# EasyEDA Pro project SOP100E 2025.05.27.eprj, schematic Schematic2

## Sheets
1 P1: Board Name: Board2; Create Date: 2026-01-20; Page Name: P1; Project Name: SOP100E 2025.05.27; Schematic Name: Schematic2; Update Date: 2026-01-21; Company: 嘉立创EDA; Page Size: A4; Version: V1.0
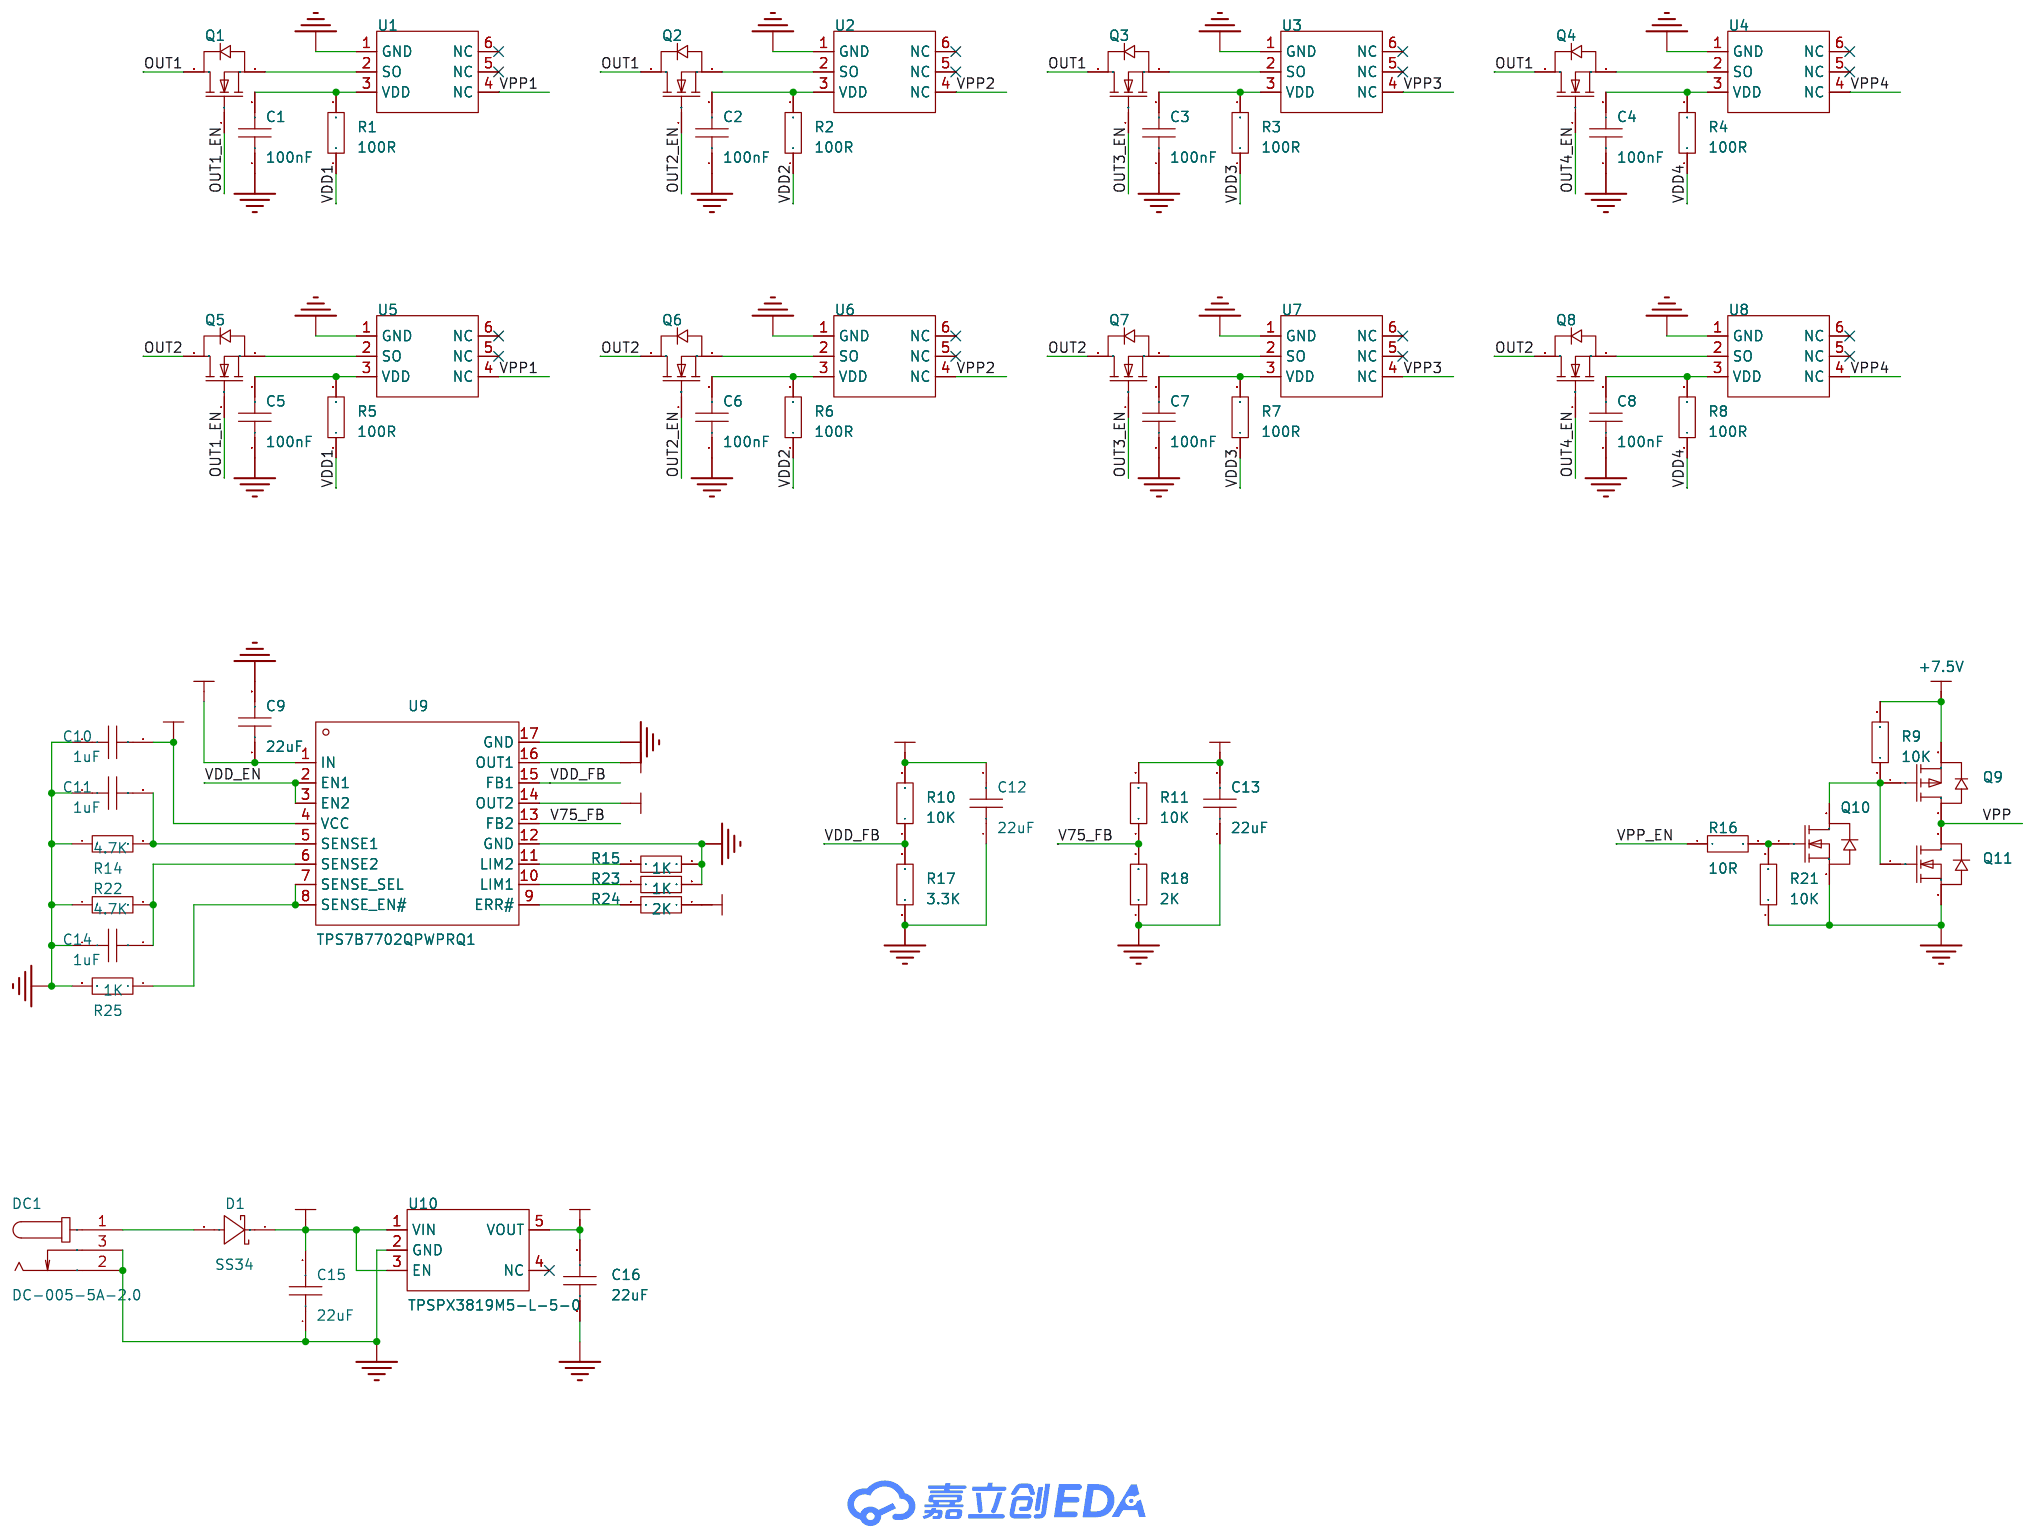
[diagram p12: P1]
2 P3: Create Date: 2026-01-21; Page Name: P3
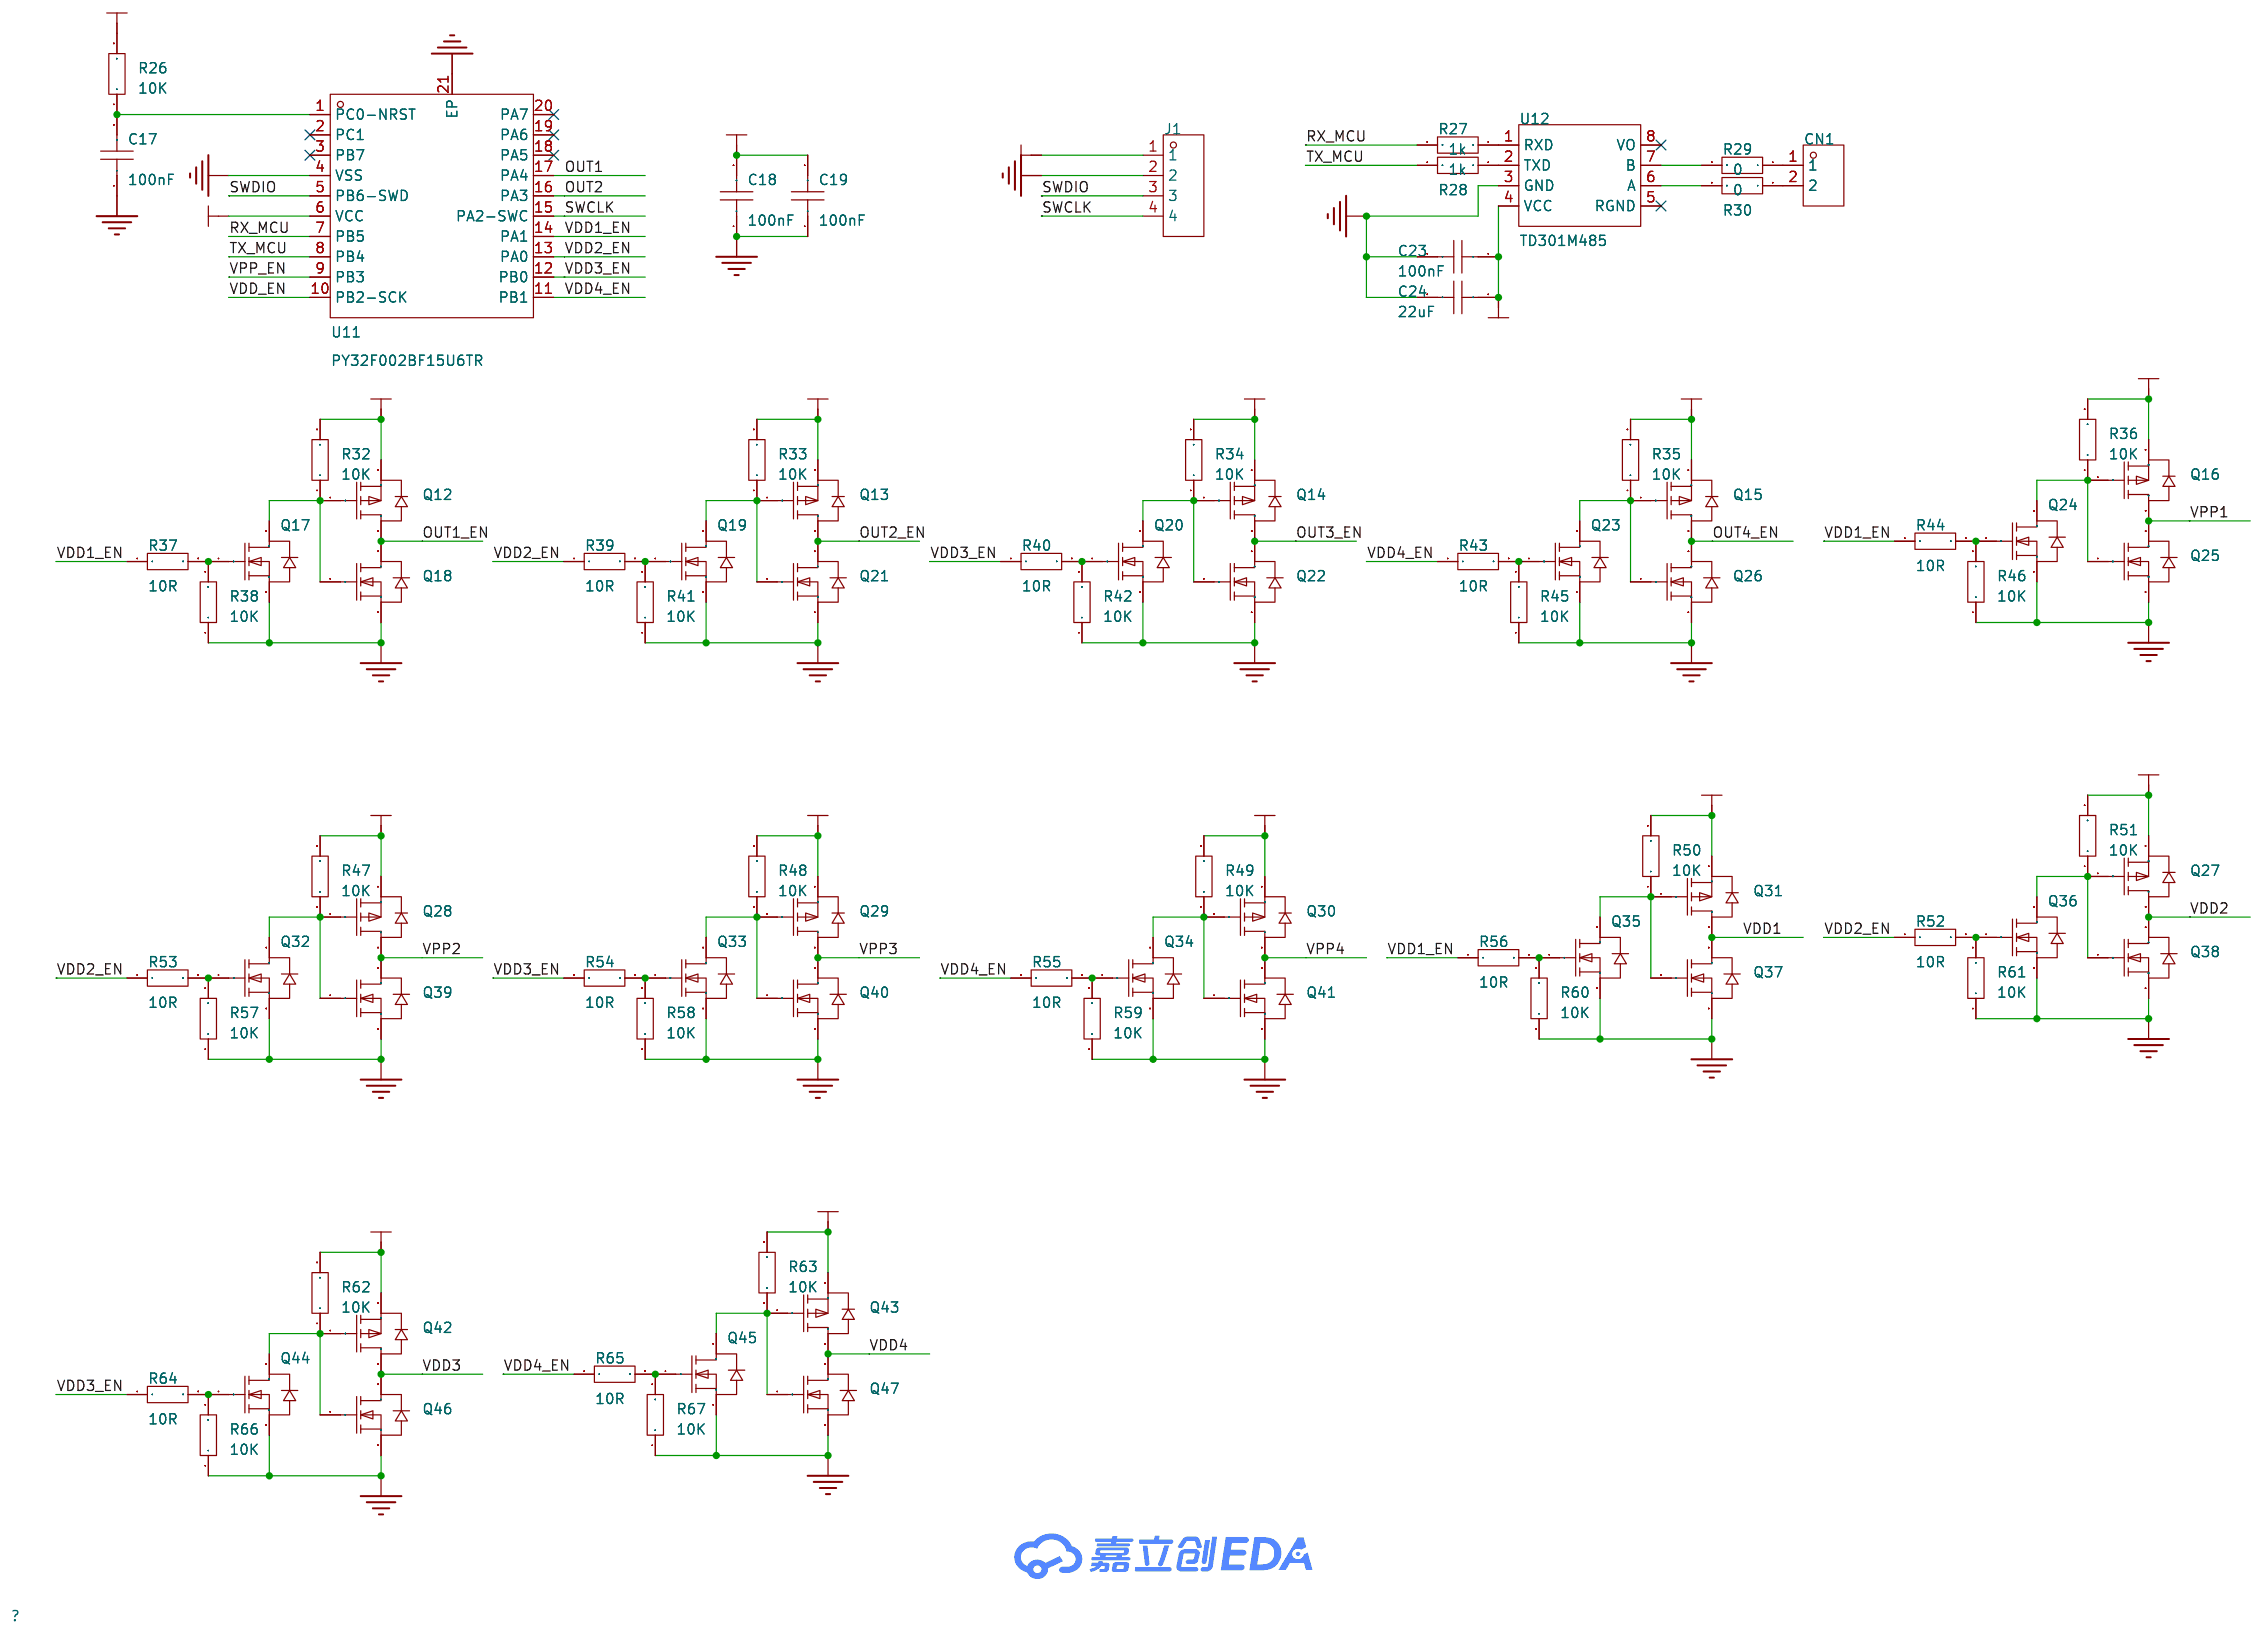
[diagram p13: P3]

## Parts
sheet P1
C1  100nF  [C0603]
C2  100nF  [C0603]
C3  100nF  [C0603]
C4  100nF  [C0603]
C5  100nF  [C0603]
C6  100nF  [C0603]
C7  100nF  [C0603]
C8  100nF  [C0603]
C9  22uF  [C0805]
C10  1uF  [C0603]
C11  1uF  [C0603]
C12  22uF  [C0805]
C13  22uF  [C0805]
C14  1uF  [C0603]
C15  22uF  [C0805]
C16  22uF  [C0805]
D1  SS34  [SMA_L4.3-W2.5-LS5.0-RD]
DC1  DC-005-5A-2.0  [DC-IN-TH_DC-005-5A-2.0]
Q1  AO3400A  [SOT-23-3_L2.9-W1.3-P1.90-LS2.4-BR]
Q2  AO3400A  [SOT-23-3_L2.9-W1.3-P1.90-LS2.4-BR]
Q3  AO3400A  [SOT-23-3_L2.9-W1.3-P1.90-LS2.4-BR]
Q4  AO3400A  [SOT-23-3_L2.9-W1.3-P1.90-LS2.4-BR]
Q5  AO3400A  [SOT-23-3_L2.9-W1.3-P1.90-LS2.4-BR]
Q6  AO3400A  [SOT-23-3_L2.9-W1.3-P1.90-LS2.4-BR]
Q7  AO3400A  [SOT-23-3_L2.9-W1.3-P1.90-LS2.4-BR]
Q8  AO3400A  [SOT-23-3_L2.9-W1.3-P1.90-LS2.4-BR]
Q9  AO3401A  [SOT-23_L2.9-W1.3-P1.90-LS2.4-BR]
Q10  AO3400A  [SOT-23-3_L2.9-W1.3-P1.90-LS2.4-BR]
Q11  AO3400A  [SOT-23-3_L2.9-W1.3-P1.90-LS2.4-BR]
R1  100R  [R0603]
R2  100R  [R0603]
R3  100R  [R0603]
R4  100R  [R0603]
R5  100R  [R0603]
R6  100R  [R0603]
R7  100R  [R0603]
R8  100R  [R0603]
R9  10K  [R0603]
R10  10K  [R0603]
R11  10K  [R0603]
R14  4.7K  [R0603]
R15  1K  [R0603]
R16  10R  [R0603]
R17  3.3K  [R0603]
R18  2K  [R0603]
R21  10K  [R0603]
R22  4.7K  [R0603]
R23  1K  [R0603]
R24  2K  [R0603]
R25  1K  [R0603]
U1  WF100E 1BG S6 DA 0.5P4.5 AT  [SOP-6_L7.0-W7.0-P2.54-LS10.3-TL-CW]
U2  WF100E 1BG S6 DA 0.5P4.5 AT  [SOP-6_L7.0-W7.0-P2.54-LS10.3-TL-CW]
U3  WF100E 1BG S6 DA 0.5P4.5 AT  [SOP-6_L7.0-W7.0-P2.54-LS10.3-TL-CW]
U4  WF100E 1BG S6 DA 0.5P4.5 AT  [SOP-6_L7.0-W7.0-P2.54-LS10.3-TL-CW]
U5  WF100E 1BG S6 DA 0.5P4.5 AT  [SOP-6_L7.0-W7.0-P2.54-LS10.3-TL-CW]
U6  WF100E 1BG S6 DA 0.5P4.5 AT  [SOP-6_L7.0-W7.0-P2.54-LS10.3-TL-CW]
U7  WF100E 1BG S6 DA 0.5P4.5 AT  [SOP-6_L7.0-W7.0-P2.54-LS10.3-TL-CW]
U8  WF100E 1BG S6 DA 0.5P4.5 AT  [SOP-6_L7.0-W7.0-P2.54-LS10.3-TL-CW]
U9  TPS7B7702QPWPRQ1  [HTSSOP-16_L5.0-W4.4-P0.65-LS6.4-BL-EP]
U10  TPSPX3819M5-L-5-0  [SOT-23-5_L2.9-W1.6-P0.95-LS2.8-BR]
sheet P3
C17  100nF  [C0603]
C18  100nF  [C0603]
C19  100nF  [C0603]
C23  100nF  [C0603]
C24  22uF  [C0805]
CN1  DB2EVC-2.5-2P-GN  [CONN-TH_2P-P2.50_DB2EVC-2.5-2P-GN]
J1  PZ254V-11-04P  [HDR-TH_4P-P2.54-V-M]
Q12  AO3401A  [SOT-23_L2.9-W1.3-P1.90-LS2.4-BR]
Q13  AO3401A  [SOT-23_L2.9-W1.3-P1.90-LS2.4-BR]
Q14  AO3401A  [SOT-23_L2.9-W1.3-P1.90-LS2.4-BR]
Q15  AO3401A  [SOT-23_L2.9-W1.3-P1.90-LS2.4-BR]
Q16  AO3401A  [SOT-23_L2.9-W1.3-P1.90-LS2.4-BR]
Q17  AO3400A  [SOT-23-3_L2.9-W1.3-P1.90-LS2.4-BR]
Q18  AO3400A  [SOT-23-3_L2.9-W1.3-P1.90-LS2.4-BR]
Q19  AO3400A  [SOT-23-3_L2.9-W1.3-P1.90-LS2.4-BR]
Q20  AO3400A  [SOT-23-3_L2.9-W1.3-P1.90-LS2.4-BR]
Q21  AO3400A  [SOT-23-3_L2.9-W1.3-P1.90-LS2.4-BR]
Q22  AO3400A  [SOT-23-3_L2.9-W1.3-P1.90-LS2.4-BR]
Q23  AO3400A  [SOT-23-3_L2.9-W1.3-P1.90-LS2.4-BR]
Q24  AO3400A  [SOT-23-3_L2.9-W1.3-P1.90-LS2.4-BR]
Q25  AO3400A  [SOT-23-3_L2.9-W1.3-P1.90-LS2.4-BR]
Q26  AO3400A  [SOT-23-3_L2.9-W1.3-P1.90-LS2.4-BR]
Q27  AO3401A  [SOT-23_L2.9-W1.3-P1.90-LS2.4-BR]
Q28  AO3401A  [SOT-23_L2.9-W1.3-P1.90-LS2.4-BR]
Q29  AO3401A  [SOT-23_L2.9-W1.3-P1.90-LS2.4-BR]
Q30  AO3401A  [SOT-23_L2.9-W1.3-P1.90-LS2.4-BR]
Q31  AO3401A  [SOT-23_L2.9-W1.3-P1.90-LS2.4-BR]
Q32  AO3400A  [SOT-23-3_L2.9-W1.3-P1.90-LS2.4-BR]
Q33  AO3400A  [SOT-23-3_L2.9-W1.3-P1.90-LS2.4-BR]
Q34  AO3400A  [SOT-23-3_L2.9-W1.3-P1.90-LS2.4-BR]
Q35  AO3400A  [SOT-23-3_L2.9-W1.3-P1.90-LS2.4-BR]
Q36  AO3400A  [SOT-23-3_L2.9-W1.3-P1.90-LS2.4-BR]
Q37  AO3400A  [SOT-23-3_L2.9-W1.3-P1.90-LS2.4-BR]
Q38  AO3400A  [SOT-23-3_L2.9-W1.3-P1.90-LS2.4-BR]
Q39  AO3400A  [SOT-23-3_L2.9-W1.3-P1.90-LS2.4-BR]
Q40  AO3400A  [SOT-23-3_L2.9-W1.3-P1.90-LS2.4-BR]
Q41  AO3400A  [SOT-23-3_L2.9-W1.3-P1.90-LS2.4-BR]
Q42  AO3401A  [SOT-23_L2.9-W1.3-P1.90-LS2.4-BR]
Q43  AO3401A  [SOT-23_L2.9-W1.3-P1.90-LS2.4-BR]
Q44  AO3400A  [SOT-23-3_L2.9-W1.3-P1.90-LS2.4-BR]
Q45  AO3400A  [SOT-23-3_L2.9-W1.3-P1.90-LS2.4-BR]
Q46  AO3400A  [SOT-23-3_L2.9-W1.3-P1.90-LS2.4-BR]
Q47  AO3400A  [SOT-23-3_L2.9-W1.3-P1.90-LS2.4-BR]
R26  10K  [R0603]
R27  1k  [R0603]
R28  1k  [R0603]
R29  0  [R0603]
R30  0  [R0603]
R32  10K  [R0603]
R33  10K  [R0603]
R34  10K  [R0603]
R35  10K  [R0603]
R36  10K  [R0603]
R37  10R  [R0603]
R38  10K  [R0603]
R39  10R  [R0603]
R40  10R  [R0603]
R41  10K  [R0603]
R42  10K  [R0603]
R43  10R  [R0603]
R44  10R  [R0603]
R45  10K  [R0603]
R46  10K  [R0603]
R47  10K  [R0603]
R48  10K  [R0603]
R49  10K  [R0603]
R50  10K  [R0603]
R51  10K  [R0603]
R52  10R  [R0603]
R53  10R  [R0603]
R54  10R  [R0603]
R55  10R  [R0603]
R56  10R  [R0603]
R57  10K  [R0603]
R58  10K  [R0603]
R59  10K  [R0603]
R60  10K  [R0603]
R61  10K  [R0603]
R62  10K  [R0603]
R63  10K  [R0603]
R64  10R  [R0603]
R65  10R  [R0603]
R66  10K  [R0603]
R67  10K  [R0603]
U11  PY32F002BF15U6TR  [QFN-20_L3.0-W3.0-P0.40-TL-EP1.7]
U12  TD301M485  [COMM-TH_TD301M485]

## Library data of the parts
C1-C8 C10 C11 C14 C17-C19 C23 = CAP_0603: Supplier Footprint: 0603
C9 C12 C13 C15 C16 C24 = CAP_0805: Supplier Footprint: 0805
D1 = SS34_C727060: 二极管配置:独立式;正向压降(Vf):550mV@3A;直流反向耐压(Vr):40V;平均整流电流(Io):3A;; LCSC Part Name: 电压:40V 电流:3A; Supplier Part: C727060; Manufacturer: TWGMC(台湾迪嘉); Supplier Footprint: SMA(DO-214AC); JLCPCB Part Class: Extended Part; Datasheet: https://atta.szlcsc.com/upload/public/pdf/source/20200828/C727059_6599B6CAC5F3238B9C33E46794659DBE.pdf; Supplier: LCSC; Diode Configuration: 独立式; Forward Voltage (Vf@If): 550mV@3A; Reverse Voltage (Vr): 40V; Average Rectified Current (Io): 3A; Reverse Leakage Current (Ir): 500uA@40V
DC1 = DC-005-5A-2.0: 连接器类型:DC电源插座;触点内径:2mm;触点外径:6.2mm;额定电流:5A;额定电压:24V;触头材质:黄铜;工作温度范围:-20℃~+70℃;焊接温度(最大值):260℃;; LCSC Part Name: DC电源插座 内径:2mm 外径:6.2mm; Supplier Part: C381116; Manufacturer: XKB Connectivity(中国星坤); Supplier Footprint: 插件; JLCPCB Part Class: Extended Part; Datasheet: https://atta.szlcsc.com/upload/public/pdf/source/20211015/707A35F7AB6E89C57AAB641950105BB7.pdf; Supplier: LCSC; Connector Type: DC电源插座; Inside Contact Diameter: 2mm; Outside Contact Diameter: 6.2mm; Current Rating (Max): 5A; Voltage Rating (Max): 24V; Operating Temperature Range: -20℃~+70℃; Contact Material: 黄铜; Welding Temperature (Max): 260℃
Q1-Q8 Q10 Q11 Q17-Q26 Q32-Q41 Q44-Q47 = AO3400A_C20917: LCSC Part Name: 1个N沟道 耐压:30V 电流:5.7A; Supplier Part: C20917; Manufacturer: AOS; Supplier Footprint: SOT-23-3L; JLCPCB Part Class: 基础库; Datasheet: https://item.szlcsc.com/datasheet/AO3400A/21629.html; Supplier: LCSC; Drain to Source Voltage: 30V; RDS(on): 48mΩ@2.5V; Gate Threshold Voltage (Vgs(th)): 1.45V@250uA; Gate Charge(Qg): 7nC@10V; Input Capacitance(Ciss): 630pF@15V; Operating Temperature: -55℃~+150℃@(Tj); Type: N沟道
Q9 Q12-Q16 Q27-Q31 Q42 Q43 = AO3401A_C15127: LCSC Part Name: 1个P沟道 耐压:30V 电流:4A; Supplier Part: C15127; Manufacturer: AOS; Supplier Footprint: SOT-23; JLCPCB Part Class: 基础库; Datasheet: https://item.szlcsc.com/datasheet/AO3401A/15801.html; Supplier: LCSC; Number: 1个P沟道; Drain to Source Voltage: 30V; Current - Continuous Drain(Id): 4A; RDS(on): 47mΩ@10V；85mΩ@2.5V；60mΩ@4.5V; Gate Threshold Voltage (Vgs(th)): 900mV@250uA; Gate Charge(Qg): 14nC@10V; Input Capacitance(Ciss): 645pF; Reverse Transfer Capacitance (Crss@Vds): 55pF; Output Capacitance(Coss): 80pF
R1-R11 R14-R18 R21-R30 R32-R67 = Res_0603: Supplier Footprint: 0603
U1-U8 = WF100E 1BG S6 DA 0.5P4.5 AT: Supplier Part: C22388670; Manufacturer: WF(伟烽); Supplier Footprint: SOP-6; JLCPCB Part Class: 扩展库; Datasheet: https://item.szlcsc.com/datasheet/WF100E%25201BG%2520S6%2520DA%25200.5P4.5%2520AT/23957601.html; Supplier: LCSC; Pressure range: 0Kpa~1bar; Voltage - Supply: 5V; Operating Temperature: -40℃~+125℃
U9 = TPS7B7702QPWPRQ1: 输出类型:可调;最大输入电压:40V;输出电压:1.5V~20V;输出电流:300mA;电源纹波抑制比(PSRR):73dB@(100Hz);; LCSC Part Name: 汽车类 300mA、电池供电运行 (40V)、双通道可调节天线低压降稳压器; Supplier Part: C575546; Manufacturer: TI(德州仪器); Supplier Footprint: HTSSOP-16-EP; JLCPCB Part Class: 扩展库; Datasheet: https://www.ti.com/cn/lit/gpn/tps7b7702-q1; Supplier: LCSC; Output Type: 可调; Maximum Input Voltage: 40V; Output Voltage: 1.5V~20V; Output Current: 300mA; Power Supply Rejection Ratio (PSRR): 73dB@(100Hz); Operating Temperature: -40℃~+150℃@(Tj)
U10 = TPSPX3819M5-L-5-0: LCSC Part Name: 20V、500mA、5μA，高电源抑制比电压调节器; Supplier Part: C5370987; Manufacturer: TECH PUBLIC(台舟); Supplier Footprint: SOT-23-5; JLCPCB Part Class: 扩展库; Datasheet: https://item.szlcsc.com/datasheet/TPSPX3819M5-L-5-0/6218024.html; Supplier: LCSC; Output Type: 固定; Voltage - Supply: 20V; Output Voltage: 5V; Output Current: 500mA; Power Supply Rejection Ratio (PSRR): 70dB@(1kHz); Voltage Dropout: 350mV@(100mA); standby current: 5uA; Features: 带使能；过流保护；过热保护; Operating Temperature: -40℃~+85℃@(Ta); Output Configuration: 正极; Number of Outputs: 1
CN1 = DB2EVC-2.5-2P-GN: 连接器类型:板端/插座-闭口;结构:1x2P;间距:2.5mm;颜色:绿色;安装方式:直针;排数:1;每排PIN数:2;额定电流:5A;额定电压:150V;工作温度:-40℃~+105℃;; LCSC Part Name: 2.5mm 1x2P 排数:1 每排P数:2; Supplier Part: C2924411; Manufacturer: DORABO(地博电气); Supplier Footprint: 插件,P=2.5mm; JLCPCB Part Class: 扩展库; Datasheet: https://atta.szlcsc.com/upload/public/pdf/source/20230321/C1039C1DACA390651A0DC069860749DA.pdf; Supplier: LCSC; Connector Type: 板端/插座-闭口; Number of Positions or Pins: 1x2P; Pitch: 2.5mm; Color: 绿色; Mounting Type: 直针; Number of Pins: 2P; Number of Rows: 1; Number of PINs Per Row: 2; Current Rating: 5A; Voltage Rating (Max): 150V; Operating Temperature: -40℃~+105℃
J1 = PZ254V-11-04P: 插针结构:1x4P;间距:2.54mm;行距:-;圆针/方针:方针;安装类型:直插;排数:单排;总PIN位数:4P;额定电流:3A;额定电压:250V;配合针长度:6mm;塑高:2.5mm;端接针长度:3mm;触头材质:-;工作温度范围:-40℃~+105℃;颜色:黑色;; LCSC Part Name: 间距:2.54mm 1x4P 直插 方针; Supplier Part: C2691448; Manufacturer: XFCN(兴飞); Supplier Footprint: 插件,P=2.54mm; JLCPCB Part Class: 扩展库; Datasheet: https://atta.szlcsc.com/upload/public/pdf/source/20200309/C492403_F9F19131791D08044AD4F84F8E751A34.pdf; Supplier: LCSC; Pin Structure: 1x4P; Pitch: 2.54mm; Circluar Pins/Square Pins: 方针; Mounting Type: 直插; Number of Rows: 单排; Number of Pins: 4P; Current Rating (Max): 3A; Voltage Rating (Max): 250V; Length of Mating Pin: 6mm; Insulation Height: 2.5mm; Length of End Connection Pin: 3mm; Operating Temperature Range: -40℃~+105℃; Color: 黑色
U11 = PY32F002BF15U6TR: LCSC Part Name: 32位ARMCortex-M0+微控制器; Supplier Part: C7469099; Manufacturer: PUYA(普冉); Supplier Footprint: QFN-20-EP(3x3); JLCPCB Part Class: 扩展库; Datasheet: https://item.szlcsc.com/datasheet/PY32F002BF15U6TR/8516577.html; Supplier: LCSC
U12 = TD301M485: 数据速率:500Kbps;节点数:64;自动流控:是;; LCSC Part Name: 500Kbps 64; Supplier Part: C2682606; Manufacturer: VISOM; Supplier Footprint: DIP-8; JLCPCB Part Class: 扩展库; Datasheet: https://atta.szlcsc.com/upload/public/pdf/source/20210105/C2682606_F1AD21272F430052E64FB3724D643821.pdf; Supplier: LCSC; Data Rate: 500Kbps; ESD Protect: 是; Supply Voltage: 3.15V~3.45V; isolation: 2500V; Node Number: 64; Quiescent Current: 22mA; Automatic flow control: 是; Operating Temperature: -40℃~+85℃

## Nets
+7.5V: C13.2 Q9.2(S) Q12.2(S) Q13.2(S) Q14.2(S) Q15.2(S) R9.2 R11.2 R32.2 R33.2 R34.2 R35.2 U9.14(OUT2)
GND: C1.1 C2.1 C3.1 C4.1 C5.1 C6.1 C7.1 C8.1 C9.2 C10.1 C11.1 C12.1 C13.1 C14.1 C15.1 C16.1 C17.1 C18.1 C19.1 C23.2 C24.2 DC1.2 DC1.3 J1.2 Q10.2(S) Q11.2(S) Q17.2(S) Q18.2(S) Q19.2(S) Q20.2(S) Q21.2(S) Q22.2(S) Q23.2(S) Q24.2(S) Q25.2(S) Q26.2(S) Q32.2(S) Q33.2(S) Q34.2(S) Q35.2(S) Q36.2(S) Q37.2(S) Q38.2(S) Q39.2(S) Q40.2(S) Q41.2(S) Q44.2(S) Q45.2(S) Q46.2(S) Q47.2(S) R14.1 R15.2 R17.1 R18.1 R21.1 R22.1 R23.2 R25.2 R38.1 R41.1 R42.1 R45.1 R46.1 R57.1 R58.1 R59.1 R60.1 R61.1 R66.1 R67.1 U1.1(GND) U2.1(GND) U3.1(GND) U4.1(GND) U5.1(GND) U6.1(GND) U7.1(GND) U8.1(GND) U9.12(GND) U9.17(GND) U10.2(GND) U11.4(VSS) U11.21(EP) U12.3(GND)
V75_FB: R11.1 R18.2 U9.13(FB2)
VCC: C16.2 C18.2 C19.2 C23.1 C24.1 J1.1 R26.2 U10.5(VOUT) U11.6(VCC) U12.4(VCC)
VCC_1: C10.2 R24.1 U9.4(VCC)
VDD: C12.2 Q27.2(S) Q31.2(S) Q42.2(S) Q43.2(S) R10.2 R50.2 R51.2 R62.2 R63.2 U9.16(OUT1)
VDD1: Q31.3(D) Q37.3(D) R1.1 R5.1
VDD1_EN: R37.1 R44.1 R56.1 U11.14(PA1)
VDD2: Q27.3(D) Q38.3(D) R2.1 R6.1
VDD2_EN: R39.1 R52.1 R53.1 U11.13(PA0)
VDD3: Q42.3(D) Q46.3(D) R3.1 R7.1
VDD3_EN: R40.1 R54.1 R64.1 U11.12(PB0)
VDD4: Q43.3(D) Q47.3(D) R4.1 R8.1
VDD4_EN: R43.1 R55.1 R65.1 U11.11(PB1)
VDD_EN: U9.2(EN1) U9.3(EN2) U11.10(PB2-SCK)
VDD_FB: R10.1 R17.2 U9.15(FB1)
DC12V: C9.1 C15.2 D1.1(C) U9.1(IN) U10.1(VIN) U10.3(EN)
OUT1: Q1.3(D) Q2.3(D) Q3.3(D) Q4.3(D) U11.17(PA4)
OUT1_EN: Q1.1(G) Q5.1(G) Q12.3(D) Q18.3(D)
OUT2: Q5.3(D) Q6.3(D) Q7.3(D) Q8.3(D) U11.16(PA3)
OUT2_EN: Q2.1(G) Q6.1(G) Q13.3(D) Q21.3(D)
OUT3_EN: Q3.1(G) Q7.1(G) Q14.3(D) Q22.3(D)
OUT4_EN: Q4.1(G) Q8.1(G) Q15.3(D) Q26.3(D)
RX_MCU: R27.2 U11.7(PB5)
SWCLK: J1.4 U11.15(PA2-SWC)
SWDIO: J1.3 U11.5(PB6-SWD)
TX_MCU: R28.2 U11.8(PB4)
VPP: Q9.3(D) Q11.3(D) Q16.2(S) Q28.2(S) Q29.2(S) Q30.2(S) R36.2 R47.2 R48.2 R49.2
VPP1: Q16.3(D) Q25.3(D) U1.4(NC) U5.4(NC)
VPP2: Q28.3(D) Q39.3(D) U2.4(NC) U6.4(NC)
VPP3: Q29.3(D) Q40.3(D) U3.4(NC) U7.4(NC)
VPP4: Q30.3(D) Q41.3(D) U4.4(NC) U8.4(NC)
VPP_EN: R16.1 U11.9(PB3)
$1N2752: C1.2 R1.2 U1.3(VDD)
$1N2758: Q1.2(S) U1.2(SO)
$1N2764: C2.2 R2.2 U2.3(VDD)
$1N2770: Q2.2(S) U2.2(SO)
$1N2776: C3.2 R3.2 U3.3(VDD)
$1N2782: Q3.2(S) U3.2(SO)
$1N2788: C4.2 R4.2 U4.3(VDD)
$1N2794: Q4.2(S) U4.2(SO)
$1N2812: C5.2 R5.2 U5.3(VDD)
$1N2818: Q5.2(S) U5.2(SO)
$1N2824: C6.2 R6.2 U6.3(VDD)
$1N2830: Q6.2(S) U6.2(SO)
$1N2836: C7.2 R7.2 U7.3(VDD)
$1N2842: Q7.2(S) U7.2(SO)
$1N2848: C8.2 R8.2 U8.3(VDD)
$1N2854: Q8.2(S) U8.2(SO)
$1N4080: D1.2(A) DC1.1
$1N4983: R15.1 U9.11(LIM2)
$1N4984: R23.1 U9.10(LIM1)
$1N4985: R24.2 U9.9(ERR#)
$1N4990: C11.2 R14.2 U9.5(SENSE1)
$1N4991: R25.1 U9.7(SENSE_SEL) U9.8(SENSE_EN#)
$1N4992: C14.2 R22.2 U9.6(SENSE2)
$1N5558: Q10.1(G) R16.2 R21.2
$1N5563: Q9.1(G) Q10.3(D) Q11.1(G) R9.1
$3N1296: R29.2 U12.7(B)
$3N1297: R30.2 U12.6(A)
$3N1304: CN1.1 R29.1
$3N1305: CN1.2 R30.1
$3N1306: R27.1 U12.1(RXD)
$3N1307: R28.1 U12.2(TXD)
$3N1779: C17.2 R26.1 U11.1(PC0-NRST)
$3N5093: Q12.1(G) Q17.3(D) Q18.1(G) R32.1
$3N5095: Q17.1(G) R37.2 R38.2
$3N5101: Q13.1(G) Q19.3(D) Q21.1(G) R33.1
$3N5103: Q19.1(G) R39.2 R41.2
$3N5107: Q20.1(G) R40.2 R42.2
$3N5110: Q15.1(G) Q23.3(D) Q26.1(G) R35.1
$3N5113: Q14.1(G) Q20.3(D) Q22.1(G) R34.1
$3N5119: Q23.1(G) R43.2 R45.2
$3N5130: Q28.1(G) Q32.3(D) Q39.1(G) R47.1
$3N5133: Q32.1(G) R53.2 R57.2
$3N5138: Q29.1(G) Q33.3(D) Q40.1(G) R48.1
$3N5141: Q33.1(G) R54.2 R58.2
$3N5146: Q30.1(G) Q34.3(D) Q41.1(G) R49.1
$3N5149: Q34.1(G) R55.2 R59.2
$3N5154: Q31.1(G) Q35.3(D) Q37.1(G) R50.1
$3N5157: Q35.1(G) R56.2 R60.2
$3N5170: Q42.1(G) Q44.3(D) Q46.1(G) R62.1
$3N5173: Q44.1(G) R64.2 R66.2
$3N5178: Q43.1(G) Q45.3(D) Q47.1(G) R63.1
$3N5181: Q45.1(G) R65.2 R67.2
$3N7897: Q16.1(G) Q24.3(D) Q25.1(G) R36.1
$3N7898: Q24.1(G) R44.2 R46.2
$3N8162: Q36.1(G) R52.2 R61.2
$3N8163: Q27.1(G) Q36.3(D) Q38.1(G) R51.1

Not connected (* = marked no-connect by the designer): U1 5(NC)* 6(NC)*; U2 5(NC)* 6(NC)*; U3 5(NC)* 6(NC)*; U4 5(NC)* 6(NC)*; U5 5(NC)* 6(NC)*; U6 5(NC)* 6(NC)*; U7 5(NC)* 6(NC)*; U8 5(NC)* 6(NC)*; U10 4(NC)*; U11 2(PC1)* 3(PB7)* 18(PA5)* 19(PA6)* 20(PA7)*; U12 5(RGND)* 8(VO)*
